# EAGLE design Dual ESC Mount (final) (EAGLE 9.6.2)
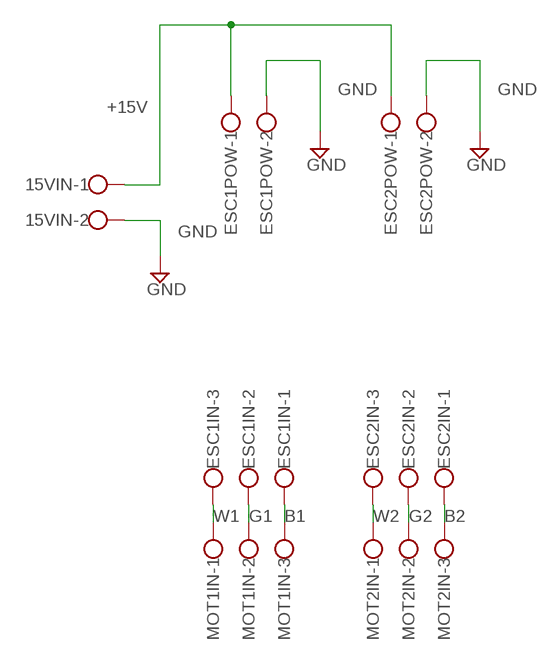
[diagram p0: schematic, sheet 1]

## Parts
15VIN  W237-102  [W237-102]
ESC1IN  W237-103  [W237-103]
ESC1POW  W237-102  [W237-102]
ESC2IN  W237-103  [W237-103]
ESC2POW  W237-102  [W237-102]
MOT1IN  W237-103  [W237-103]
MOT2IN  W237-103  [W237-103]

## Nets
+15V: 15VIN.1 ESC1POW.1 ESC2POW.1
B1: ESC1IN.1 MOT1IN.3
B2: ESC2IN.1 MOT2IN.3
G1: ESC1IN.2 MOT1IN.2
G2: ESC2IN.2 MOT2IN.2
GND: 15VIN.2 ESC1POW.2 ESC2POW.2
W1: ESC1IN.3 MOT1IN.1
W2: ESC2IN.3 MOT2IN.1

## Library data of the parts
15VIN ESC1POW ESC2POW = con-wago-500:W237-102: WAGO SCREW CLAMP; MPN: 237-102; OC_FARNELL: unknown; OC_NEWARK: 70K9898
ESC1IN ESC2IN MOT1IN MOT2IN = con-wago-500:W237-103: WAGO SCREW CLAMP; MPN: 237-103; OC_FARNELL: unknown; OC_NEWARK: 18M7116

## Board
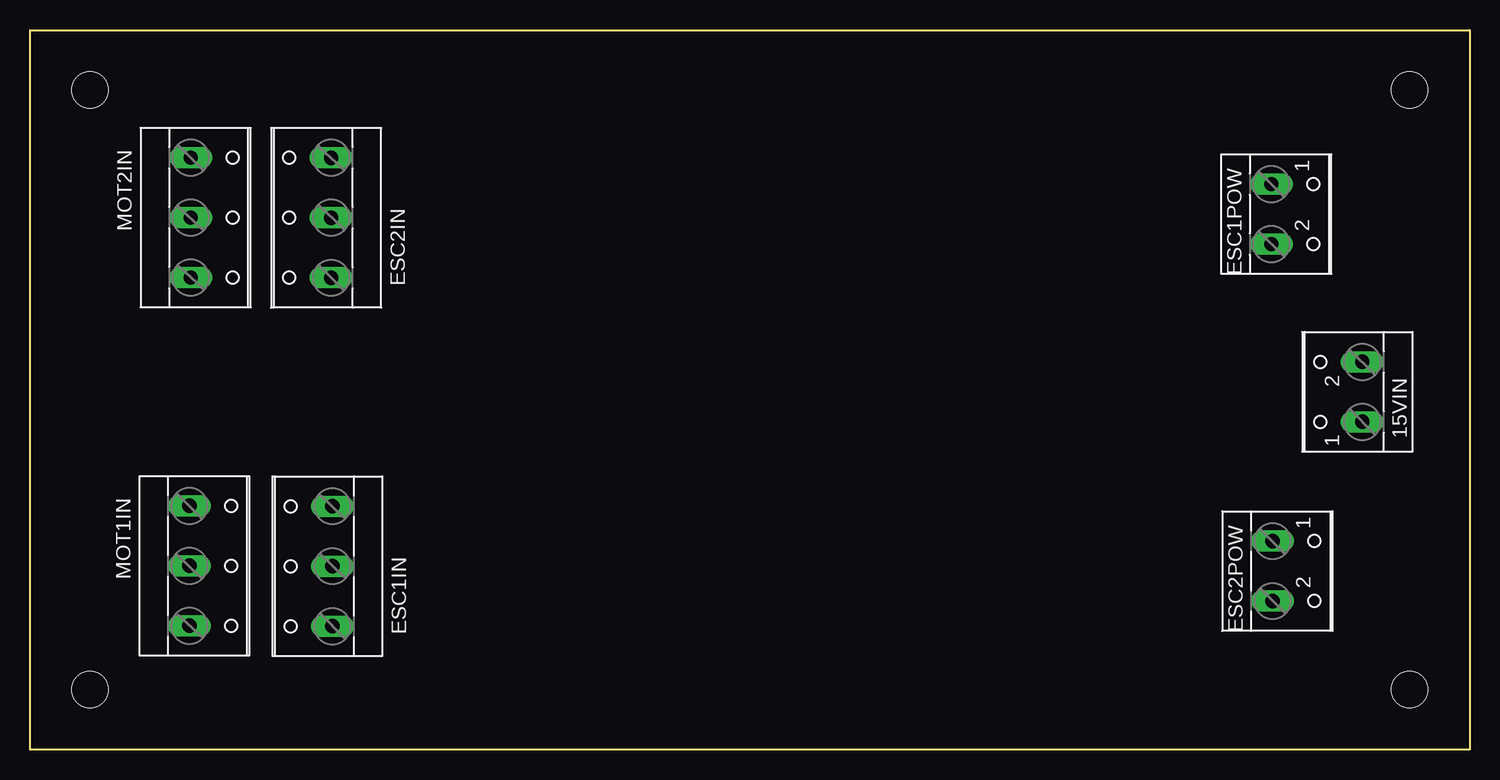
[diagram p1: board, top side]
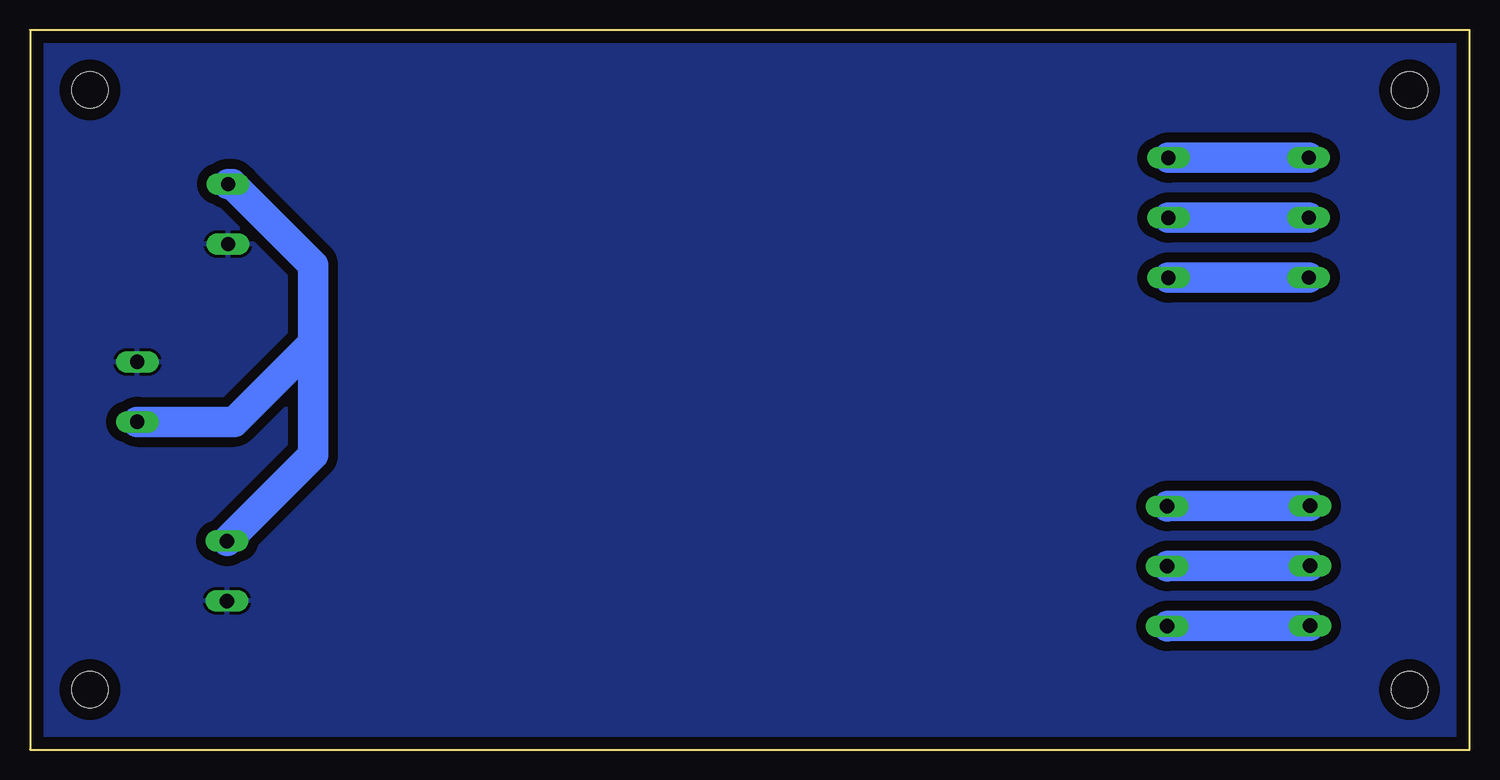
[diagram p2: board, bottom side, seen from below]

Size 120 x 60 mm. Coordinates in mm from the lower left corner, seen from the top.
Outline: 0,0 100,0
Outline: 0,0 0,60 120,60 120,0 0,0
Copper layers (1*16): Top 0.035mm / dielectric 1.5mm / Bottom 0.035mm
Design rules "default": minimum track width 6mil, minimum drill 0.35mm, track to track 6mil, track to pad 6mil, pad to pad 6mil, via to via 6mil, smd to smd 6mil, copper to edge 40mil, drill to drill 6mil, minimum pad ring 10mil, minimum via ring 8mil, stop-mask expansion 4mil, vias tented up to drill 0mil, thermal gap 10mil
Holes 3 mm at 5,55 5,5 115,5 115,55

### Footprints (pad centres in the part's own frame; a part is rotated, then mirrored left to right if it is on the bottom)
W237-102 = drill 1.194 long: 1 -2.5,-1.27; 2 2.5,-1.27
W237-103 = drill 1.194 long: 1 -5,-1.29; 2 0,-1.29; 3 5,-1.29

### Placement (x,y rotation side)
15VIN  109.79,29.82 90 top
ESC1IN  23.91,15.28 90 top
ESC1POW  104.75,44.65 270 top
ESC2IN  23.81,44.34 90 top
ESC2POW  104.85,14.88 270 top
MOT1IN  14.59,15.32 270 top
MOT2IN  14.69,44.36 270 top

### Tracks (layer width: path | path; a pad name or v marks a point on that pad's centre or on a via)
+15V
  Bottom 2.54: ESC2POW.1 96.4,24.56 96.4,33.9 | 96.4,33.9 96.4,40.4 103.15,47.15 ESC1POW.1 | 15VIN.1 102.98,27.32 96.4,33.9
B1
  Bottom 2.54: MOT1IN.3 25.16,10.32 ESC1IN.1
B2
  Bottom 2.54: MOT2IN.3 25.08,39.36 ESC2IN.1
G1
  Bottom 2.54: MOT1IN.2 25.16,15.32 ESC1IN.2
G2
  Bottom 2.54: MOT2IN.2 25.08,44.36 ESC2IN.2
GND
  pour Bottom (isolate 0.813): 0,60 120,60 120,0 0,0
W1
  Bottom 2.54: MOT1IN.1 25.16,20.32 ESC1IN.3
W2
  Bottom 2.54: MOT2IN.1 25.08,49.36 ESC2IN.3